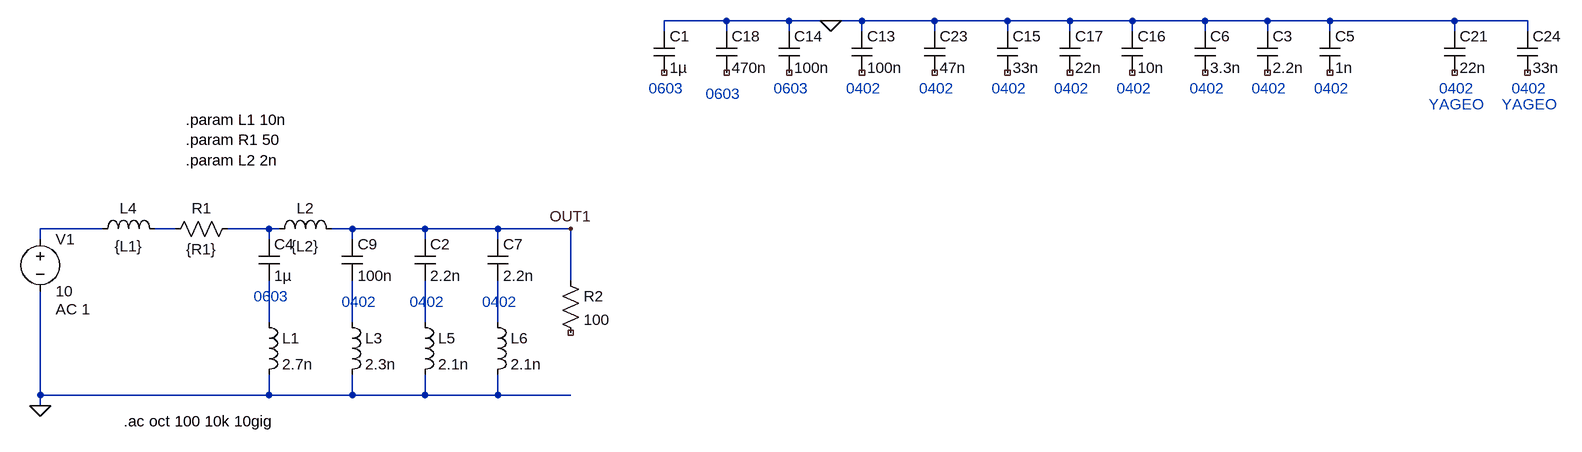
[diagram p0: schematic capacitors_antiresonance_72MHz.asc]
capacitors_antiresonance_72MHz.asc, the LTspice schematic file:
Version 4
SHEET 1 2088 680
WIRE 800 -272 704 -272
WIRE 896 -272 800 -272
WIRE 960 -272 896 -272
WIRE 1008 -272 960 -272
WIRE 1120 -272 1008 -272
WIRE 1232 -272 1120 -272
WIRE 1328 -272 1232 -272
WIRE 1424 -272 1328 -272
WIRE 1536 -272 1424 -272
WIRE 1632 -272 1536 -272
WIRE 1728 -272 1632 -272
WIRE 1920 -272 1728 -272
WIRE 2032 -272 1920 -272
WIRE 704 -256 704 -272
WIRE 800 -256 800 -272
WIRE 896 -256 896 -272
WIRE 1008 -256 1008 -272
WIRE 1120 -256 1120 -272
WIRE 1232 -256 1232 -272
WIRE 1328 -256 1328 -272
WIRE 1424 -256 1424 -272
WIRE 1536 -256 1536 -272
WIRE 1632 -256 1632 -272
WIRE 1728 -256 1728 -272
WIRE 1920 -256 1920 -272
WIRE 2032 -256 2032 -272
WIRE -160 48 -256 48
WIRE -48 48 -80 48
WIRE 96 48 32 48
WIRE 112 48 96 48
WIRE 224 48 192 48
WIRE 336 48 224 48
WIRE 448 48 336 48
WIRE 560 48 448 48
WIRE -256 64 -256 48
WIRE 96 64 96 48
WIRE 224 64 224 48
WIRE 336 64 336 48
WIRE 448 64 448 48
WIRE 560 128 560 48
WIRE 96 192 96 128
WIRE 224 192 224 128
WIRE 336 192 336 128
WIRE 448 192 448 128
WIRE -256 304 -256 144
WIRE 96 304 96 272
WIRE 96 304 -256 304
WIRE 224 304 224 272
WIRE 224 304 96 304
WIRE 336 304 336 272
WIRE 336 304 224 304
WIRE 448 304 448 272
WIRE 448 304 336 304
WIRE 560 304 448 304
WIRE -256 320 -256 304
FLAG -256 320 0
FLAG 560 48 OUT1
FLAG 960 -272 0
SYMBOL voltage -256 48 R0
WINDOW 123 24 124 Left 2
WINDOW 39 24 152 Left 2
SYMATTR Value2 AC 1
SYMATTR InstName V1
SYMATTR Value 10
SYMBOL res 48 32 R90
WINDOW 0 0 56 VBottom 2
WINDOW 3 32 56 VTop 2
SYMATTR InstName R1
SYMATTR Value {R1}
SYMBOL cap 80 64 R0
SYMATTR InstName C4
SYMATTR Value 1µ
SYMATTR SpiceLine V=50 Irms=940m Rser=6.4m Lser=532p
SYMBOL ind 96 64 R270
WINDOW 0 32 56 VTop 2
WINDOW 3 5 56 VBottom 2
SYMATTR InstName L2
SYMATTR Value {L2}
SYMBOL ind -176 64 R270
WINDOW 0 32 56 VTop 2
WINDOW 3 5 56 VBottom 2
SYMATTR InstName L4
SYMATTR Value {L1}
SYMBOL cap 208 64 R0
SYMATTR InstName C9
SYMATTR Value 100n
SYMATTR SpiceLine V=50 Irms=940m Rser=20m Lser=280p
SYMBOL cap 688 -256 R0
SYMATTR InstName C1
SYMATTR Value 1µ
SYMATTR SpiceLine V=50 Irms=940m Rser=6.4m Lser=532p
SYMBOL cap 992 -256 R0
SYMATTR InstName C13
SYMATTR Value 100n
SYMATTR SpiceLine V=50 Irms=940m Rser=20m Lser=281p
SYMBOL cap 880 -256 R0
SYMATTR InstName C14
SYMATTR Value 100n
SYMATTR SpiceLine V=50 Irms=940m Rser=22m Lser=281p
SYMBOL cap 1216 -256 R0
SYMATTR InstName C15
SYMATTR Value 33n
SYMATTR SpiceLine V=50 Irms=940m Rser=32m Lser=244p
SYMBOL cap 1408 -256 R0
SYMATTR InstName C16
SYMATTR Value 10n
SYMATTR SpiceLine V=50 Irms=247m Rser=66m Lser=243p
SYMBOL cap 1312 -256 R0
SYMATTR InstName C17
SYMATTR Value 22n
SYMATTR SpiceLine V=50 Irms=247m Rser=30m Lser=290p
SYMBOL cap 784 -256 R0
SYMATTR InstName C18
SYMATTR Value 470n
SYMATTR SpiceLine V=50 Irms=940m Rser=8.8m Lser=498p
SYMBOL cap 1904 -256 R0
SYMATTR InstName C21
SYMATTR Value 22n
SYMATTR SpiceLine V=50 Irms=247m Rser=36m Lser=175p
SYMBOL cap 2016 -256 R0
SYMATTR InstName C24
SYMATTR Value 33n
SYMATTR SpiceLine V=50 Irms=247m Rser=32m Lser=181p
SYMBOL cap 1104 -256 R0
SYMATTR InstName C23
SYMATTR Value 47n
SYMATTR SpiceLine V=50 Irms=940m Rser=31m Lser=278p
SYMBOL ind 80 176 R0
SYMATTR InstName L1
SYMATTR Value 2.7n
SYMBOL ind 208 176 R0
SYMATTR InstName L3
SYMATTR Value 2.3n
SYMBOL ind 320 176 R0
SYMATTR InstName L5
SYMATTR Value 2.1n
SYMBOL cap 1616 -256 R0
SYMATTR InstName C3
SYMATTR Value 2.2n
SYMATTR SpiceLine V=50 Irms=247m Rser=193m Lser=261p
SYMBOL cap 1712 -256 R0
SYMATTR InstName C5
SYMATTR Value 1n
SYMATTR SpiceLine V=50 Irms=247m Rser=235m Lser=247p
SYMBOL cap 1520 -256 R0
SYMATTR InstName C6
SYMATTR Value 3.3n
SYMATTR SpiceLine V=50 Irms=247m Rser=142m Lser=250p
SYMBOL cap 320 64 R0
SYMATTR InstName C2
SYMATTR Value 2.2n
SYMATTR SpiceLine V=50 Irms=247m Rser=193m Lser=261p
SYMBOL ind 432 176 R0
SYMATTR InstName L6
SYMATTR Value 2.1n
SYMBOL cap 432 64 R0
SYMATTR InstName C7
SYMATTR Value 2.2n
SYMATTR SpiceLine V=50 Irms=247m Rser=193m Lser=261p
SYMBOL res 544 112 R0
SYMATTR InstName R2
SYMATTR Value 100
TEXT -128 344 Left 2 !.ac oct 100 10k 10gig
TEXT 72 152 Left 2 ;0603
TEXT 208 160 Left 2 ;0402
TEXT 680 -168 Left 2 ;0603
TEXT 984 -168 Left 2 ;0402
TEXT 872 -168 Left 2 ;0603
TEXT 1208 -168 Left 2 ;0402
TEXT 1400 -168 Left 2 ;0402
TEXT 1304 -168 Left 2 ;0402
TEXT 768 -160 Left 2 ;0603
TEXT 1896 -168 Left 2 ;0402
TEXT 1880 -144 Left 2 ;YAGEO
TEXT 2008 -168 Left 2 ;0402
TEXT 1992 -144 Left 2 ;YAGEO
TEXT 1096 -168 Left 2 ;0402
TEXT -32 -120 Left 2 !.param L1 10n\n.param R1 50\n.param L2 2n
TEXT 312 160 Left 2 ;0402
TEXT 1608 -168 Left 2 ;0402
TEXT 1704 -168 Left 2 ;0402
TEXT 1512 -168 Left 2 ;0402
TEXT 424 160 Left 2 ;0402

The netlist it stands for:
* capacitors_antiresonance_72MHz.asc
V1 N001 0 10 AC 1
R1 N003 N002 {R1}
C4 N003 N004 1µ V=50 Irms=940m Rser=6.4m Lser=532p
L2 N003 OUT1 {L2}
L4 N001 N002 {L1}
C9 OUT1 N005 100n V=50 Irms=940m Rser=20m Lser=280p
C1 0 NC_01 1µ V=50 Irms=940m Rser=6.4m Lser=532p
C13 0 NC_02 100n V=50 Irms=940m Rser=20m Lser=281p
C14 0 NC_03 100n V=50 Irms=940m Rser=22m Lser=281p
C15 0 NC_04 33n V=50 Irms=940m Rser=32m Lser=244p
C16 0 NC_05 10n V=50 Irms=247m Rser=66m Lser=243p
C17 0 NC_06 22n V=50 Irms=247m Rser=30m Lser=290p
C18 0 NC_07 470n V=50 Irms=940m Rser=8.8m Lser=498p
C21 0 NC_08 22n V=50 Irms=247m Rser=36m Lser=175p
C24 0 NC_09 33n V=50 Irms=247m Rser=32m Lser=181p
C23 0 NC_10 47n V=50 Irms=940m Rser=31m Lser=278p
L1 N004 0 2.7n
L3 N005 0 2.3n
L5 N006 0 2.1n
C3 0 NC_11 2.2n V=50 Irms=247m Rser=193m Lser=261p
C5 0 NC_12 1n V=50 Irms=247m Rser=235m Lser=247p
C6 0 NC_13 3.3n V=50 Irms=247m Rser=142m Lser=250p
C2 OUT1 N006 2.2n V=50 Irms=247m Rser=193m Lser=261p
L6 N007 0 2.1n
C7 OUT1 N007 2.2n V=50 Irms=247m Rser=193m Lser=261p
R2 OUT1 NC_14 100
.ac oct 100 10k 10gig
* 0603
* 0402
* 0603
* 0402
* 0603
* 0402
* 0402
* 0402
* 0603
* 0402
* YAGEO
* 0402
* YAGEO
* 0402
.param L1 10n
.param R1 50
.param L2 2n
* 0402
* 0402
* 0402
* 0402
* 0402
.backanno
.end